# Altium schematic sheet SRAM.SchDoc
size A3; SheetNumber: 6; SheetTotal: 17
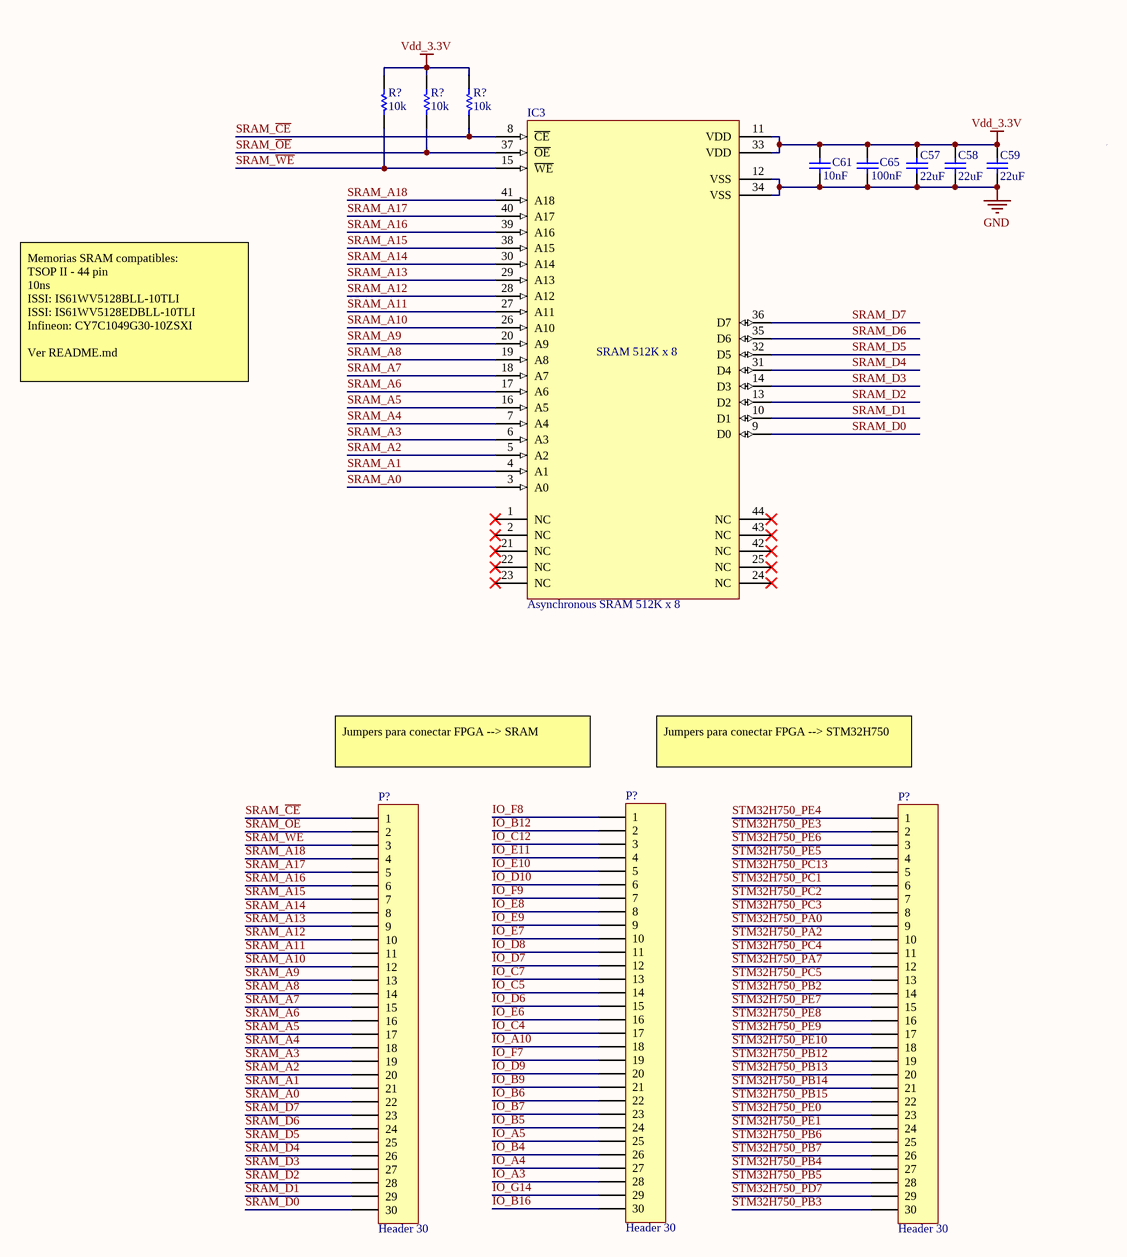
[diagram p0: SRAM.SchDoc]

## Parts
(Parts that share a designator on the sheet are numbered #1, #2 ... from top to bottom, then left to right.)
C57  value 22uF  [capacitor 0603]  (hidden comment: ceramic capacitor)
C58  value 22uF  [capacitor 0603]  (hidden comment: ceramic capacitor)
C59  value 22uF  [capacitor 0603]  (hidden comment: ceramic capacitor)
C61  value 10nF  [capacitor 0603]  (hidden comment: Ceramic capacitor)
C65  value 100nF  [capacitor 0603]  (hidden comment: Ceramic capacitor)
IC3  Asynchronous SRAM 512K x 8  [TSOP II - 44pin]
P?#1  Header 30  [HDR1X30]
P?#2  Header 30  [HDR1X30]
P?#3  Header 30  [HDR1X30]
R?#1  value 10k  [resistor 0603]  (hidden comment: resistor)
R?#2  value 10k  [resistor 0603]  (hidden comment: resistor)
R?#3  value 10k  [resistor 0603]  (hidden comment: resistor)

## Nets
GND: C57.1 C58.1 C59.1 C61.1 C65.1 IC3.12(VSS) IC3.34(VSS)
Vdd_3.3V: C57.2 C58.2 C59.2 C61.2 C65.2 IC3.11(VDD) IC3.33(VDD) R?#1.1 R?#2.1 R?#3.1
IO_A3: P?#2.28
IO_A4: P?#2.27
IO_A5: P?#2.25
IO_A10: P?#2.18
IO_B4: P?#2.26
IO_B5: P?#2.24
IO_B6: P?#2.22
IO_B7: P?#2.23
IO_B9: P?#2.21
IO_B12: P?#2.2
IO_B16: P?#2.30
IO_C4: P?#2.17
IO_C5: P?#2.14
IO_C7: P?#2.13
IO_C12: P?#2.3
IO_D6: P?#2.15
IO_D7: P?#2.12
IO_D8: P?#2.11
IO_D9: P?#2.20
IO_D10: P?#2.6
IO_E6: P?#2.16
IO_E7: P?#2.10
IO_E8: P?#2.8
IO_E9: P?#2.9
IO_E10: P?#2.5
IO_E11: P?#2.4
IO_F7: P?#2.19
IO_F8: P?#2.1
IO_F9: P?#2.7
IO_G14: P?#2.29
SRAM_A0: IC3.3(A0) P?#1.22
SRAM_A1: IC3.4(A1) P?#1.21
SRAM_A2: IC3.5(A2) P?#1.20
SRAM_A3: IC3.6(A3) P?#1.19
SRAM_A4: IC3.7(A4) P?#1.18
SRAM_A5: IC3.16(A5) P?#1.17
SRAM_A6: IC3.17(A6) P?#1.16
SRAM_A7: IC3.18(A7) P?#1.15
SRAM_A8: IC3.19(A8) P?#1.14
SRAM_A9: IC3.20(A9) P?#1.13
SRAM_A10: IC3.26(A10) P?#1.12
SRAM_A11: IC3.27(A11) P?#1.11
SRAM_A12: IC3.28(A12) P?#1.10
SRAM_A13: IC3.29(A13) P?#1.9
SRAM_A14: IC3.30(A14) P?#1.8
SRAM_A15: IC3.38(A15) P?#1.7
SRAM_A16: IC3.39(A16) P?#1.6
SRAM_A17: IC3.40(A17) P?#1.5
SRAM_A18: IC3.41(A18) P?#1.4
SRAM_~{CE}: IC3.8(~{CE}) P?#1.1 R?#3.2
SRAM_D0: IC3.9(D0) P?#1.30
SRAM_D1: IC3.10(D1) P?#1.29
SRAM_D2: IC3.13(D2) P?#1.28
SRAM_D3: IC3.14(D3) P?#1.27
SRAM_D4: IC3.31(D4) P?#1.26
SRAM_D5: IC3.32(D5) P?#1.25
SRAM_D6: IC3.35(D6) P?#1.24
SRAM_D7: IC3.36(D7) P?#1.23
SRAM_~{OE}: IC3.37(~{OE}) P?#1.2 R?#2.2
SRAM_~{WE}: IC3.15(~{WE}) P?#1.3 R?#1.2
STM32H750_PA0: P?#3.9
STM32H750_PA2: P?#3.10
STM32H750_PA7: P?#3.12
STM32H750_PB2: P?#3.14
STM32H750_PB3: P?#3.30
STM32H750_PB4: P?#3.27
STM32H750_PB5: P?#3.28
STM32H750_PB6: P?#3.25
STM32H750_PB7: P?#3.26
STM32H750_PB12: P?#3.19
STM32H750_PB13: P?#3.20
STM32H750_PB14: P?#3.21
STM32H750_PB15: P?#3.22
STM32H750_PC1: P?#3.6
STM32H750_PC2: P?#3.7
STM32H750_PC3: P?#3.8
STM32H750_PC4: P?#3.11
STM32H750_PC5: P?#3.13
STM32H750_PC13: P?#3.5
STM32H750_PD7: P?#3.29
STM32H750_PE0: P?#3.23
STM32H750_PE1: P?#3.24
STM32H750_PE3: P?#3.2
STM32H750_PE4: P?#3.1
STM32H750_PE5: P?#3.4
STM32H750_PE6: P?#3.3
STM32H750_PE7: P?#3.15
STM32H750_PE8: P?#3.16
STM32H750_PE9: P?#3.17
STM32H750_PE10: P?#3.18

Not connected (* = marked no-connect by the designer): IC3 1(NC)* 2(NC)* 21(NC)* 22(NC)* 23(NC)* 24(NC)* 25(NC)* 42(NC)* 43(NC)* 44(NC)*

## Notes on the sheet
- Memorias SRAM compatibles:
  TSOP II - 44 pin
  10ns
  ISSI: IS61WV5128BLL-10TLI
  ISSI: IS61WV5128EDBLL-10TLI
  Infineon: CY7C1049G30-10ZSXI
  Ver README.md
- (near P?#1) Jumpers para conectar FPGA --> SRAM
- (near P?#3) Jumpers para conectar FPGA --> STM32H750
- (in symbol Asynchronous SRAM 512K x 8) SRAM 512K x 8

## Library data of the parts
C57-C59 = ceramic capacitor: Multilayer ceramic capacitor; V: 6.3; LCSC part: C59461; Package: 0603
C61 C65 = Ceramic capacitor: Multilayer ceramic capacitor; V: 50; Package: 0603
  C61: LCSC part: C1591
  C65: LCSC part: C14663
IC3 = Asynchronous SRAM 512K x 8: MFR: ISSI; MFR part: IS61WV5128BLL-10TLI; Temp: −40 to +85 °C; Package: TSOP II - 44pin
P?#1-P?#3 = Header 30: Header, 30-Pin; LatestRevisionDate: 17-Jul-2002; LatestRevisionNote: Re-released for DXP Platform.; Publisher: Altium Limited
R?#1-R?#3 = resistor: Package: 0603